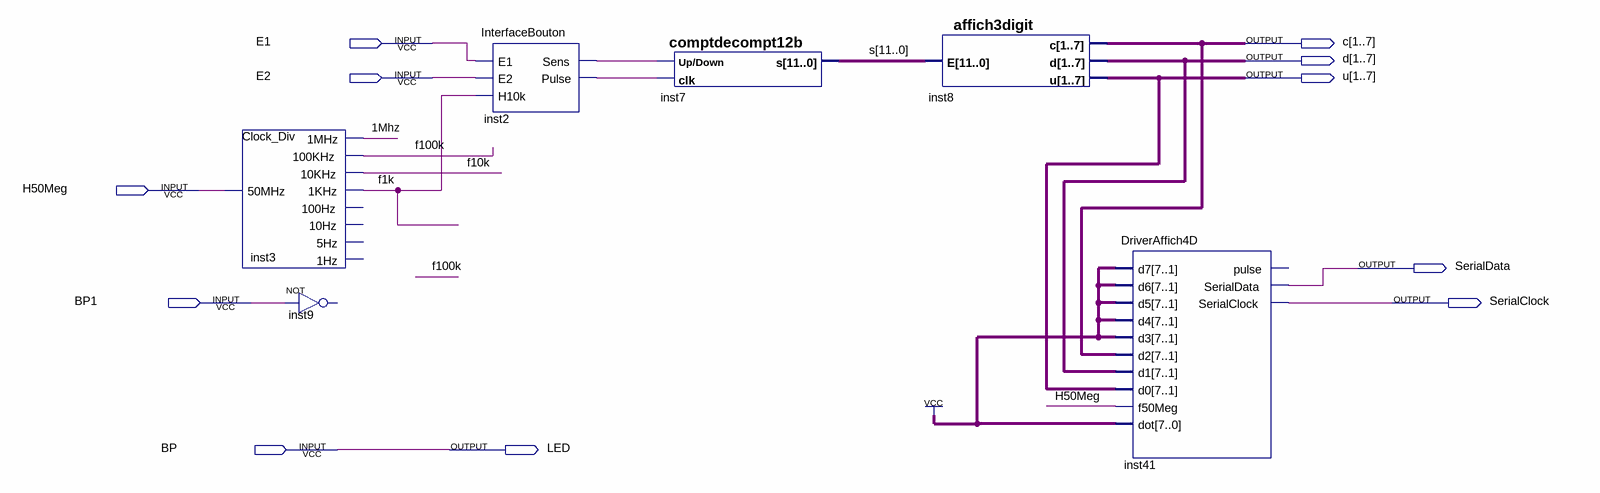
[diagram p0: schematic sheet]
// Quartus schematic Afficheur8D.bdf as structural Verilog: 6 symbols, 11 pins
module Afficheur8D (
  input  E1,
  input  E2,
  input  H50Meg,
  input  BP1,
  input  BP,
  output [1:7] c,
  output [1:7] d,
  output [1:7] u,
  output SerialData,
  output SerialClock,
  output LED
);

  wire \1Mhz , f1k, f10k, f100k, inst2_pulse, inst2_sens;
  wire [11:0] s;

  Clock_Div inst3 (
    .\50MHz (H50Meg), .\1MHz (\1Mhz ), .\100KHz (f100k), .\10KHz (f10k), .\1KHz (f1k));  // open: 100Hz, 10Hz, 5Hz, 1Hz
  // NOT inst9 has open pins: IN=BP1, OUT=open
  InterfaceBouton inst2 (.E1(E1), .E2(E2), .H10k(f1k), .Sens(inst2_sens), .Pulse(inst2_pulse));
  comptdecompt12b inst7 (.\Up/Down (inst2_sens), .clk(inst2_pulse), .s(s));
  affich3digit inst8 (.E(s), .c(c), .d(d), .u(u));
  DriverAffich4D inst41 (
    .d7({8{1'b1}}), .d6({8{1'b1}}), .d5({8{1'b1}}), .d4({8{1'b1}}), .d3({8{1'b1}}), .d2(c), .d1(d), .d0(u),
    .f50Meg(H50Meg), .dot({8{1'b1}}), .SerialData(SerialData), .SerialClock(SerialClock));  // open: pulse

  assign LED = BP;
endmodule
